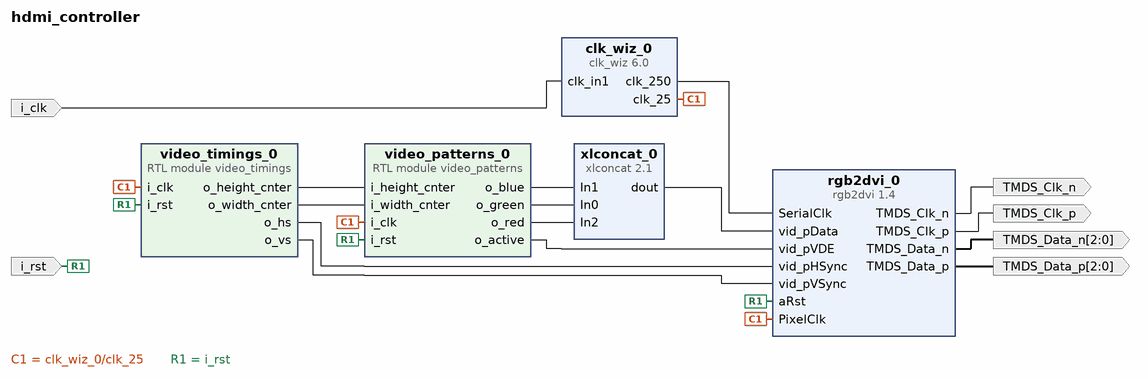
[diagram p0: block diagram of the top level]
# Vivado block design hdmi_controller, xc7z020clg400-1, Vivado 2025.2.1
create_bd_design hdmi_controller

create_bd_port -dir I -type clk i_clk
set_property -dict {CONFIG.FREQ_HZ 125000000} [get_bd_ports i_clk]
create_bd_port -dir I -type rst i_rst
set_property -dict {CONFIG.POLARITY ACTIVE_HIGH} [get_bd_ports i_rst]
create_bd_port -dir O -type clk TMDS_Clk_p
create_bd_port -dir O -type clk TMDS_Clk_n
create_bd_port -dir O -from 2 -to 0 TMDS_Data_p
create_bd_port -dir O -from 2 -to 0 TMDS_Data_n

create_bd_cell -type ip -vlnv digilentinc.com:ip:rgb2dvi:1.4 rgb2dvi_0
set_property -dict {CONFIG.kGenerateSerialClk false CONFIG.kRstActiveHigh true} [get_bd_cells rgb2dvi_0]
create_bd_cell -type module -reference video_timings video_timings_0
create_bd_cell -type module -reference video_patterns video_patterns_0
create_bd_cell -type ip -vlnv xilinx.com:ip:xlconcat:2.1 xlconcat_0
set_property -dict {CONFIG.IN0_WIDTH 8 CONFIG.IN1_WIDTH 8 CONFIG.IN2_WIDTH 8 CONFIG.NUM_PORTS 3} [get_bd_cells xlconcat_0]
create_bd_cell -type ip -vlnv xilinx.com:ip:clk_wiz:6.0 clk_wiz_0
set_property -dict [list \
  CONFIG.CLKIN1_JITTER_PS 80.0 \
  CONFIG.CLKOUT1_JITTER 165.419 \
  CONFIG.CLKOUT1_PHASE_ERROR 96.948 \
  CONFIG.CLKOUT1_REQUESTED_OUT_FREQ 25 \
  CONFIG.CLKOUT2_JITTER 104.759 \
  CONFIG.CLKOUT2_PHASE_ERROR 96.948 \
  CONFIG.CLKOUT2_REQUESTED_OUT_FREQ 250 \
  CONFIG.CLKOUT2_USED true \
  CONFIG.CLK_OUT1_PORT clk_25 \
  CONFIG.CLK_OUT2_PORT clk_250 \
  CONFIG.MMCM_CLKFBOUT_MULT_F 8.000 \
  CONFIG.MMCM_CLKIN1_PERIOD 8.000 \
  CONFIG.MMCM_CLKOUT0_DIVIDE_F 40.000 \
  CONFIG.MMCM_CLKOUT1_DIVIDE 4 \
  CONFIG.NUM_OUT_CLKS 2 \
  CONFIG.PRIM_IN_FREQ 125 \
  CONFIG.USE_LOCKED false \
  CONFIG.USE_RESET false \
] [get_bd_cells clk_wiz_0]

# ---- connections ----

connect_bd_net -net clk_in1_0_1 [get_bd_ports i_clk] [get_bd_pins clk_wiz_0/clk_in1]
connect_bd_net [get_bd_pins clk_wiz_0/clk_25] \
  [get_bd_pins video_timings_0/i_clk] [get_bd_pins rgb2dvi_0/PixelClk] [get_bd_pins video_patterns_0/i_clk]
connect_bd_net [get_bd_pins clk_wiz_0/clk_250] [get_bd_pins rgb2dvi_0/SerialClk]
connect_bd_net -net i_rst_0_1 [get_bd_ports i_rst] \
  [get_bd_pins video_timings_0/i_rst] [get_bd_pins rgb2dvi_0/aRst] [get_bd_pins video_patterns_0/i_rst]
connect_bd_net [get_bd_pins rgb2dvi_0/TMDS_Clk_n] [get_bd_ports TMDS_Clk_n]
connect_bd_net [get_bd_pins rgb2dvi_0/TMDS_Clk_p] [get_bd_ports TMDS_Clk_p]
connect_bd_net [get_bd_pins rgb2dvi_0/TMDS_Data_n] [get_bd_ports TMDS_Data_n]
connect_bd_net [get_bd_pins rgb2dvi_0/TMDS_Data_p] [get_bd_ports TMDS_Data_p]
connect_bd_net [get_bd_pins video_patterns_0/o_active] [get_bd_pins rgb2dvi_0/vid_pVDE]
connect_bd_net [get_bd_pins video_patterns_0/o_blue] [get_bd_pins xlconcat_0/In1]
connect_bd_net [get_bd_pins video_patterns_0/o_green] [get_bd_pins xlconcat_0/In0]
connect_bd_net [get_bd_pins video_patterns_0/o_red] [get_bd_pins xlconcat_0/In2]
connect_bd_net [get_bd_pins video_timings_0/o_height_cnter] [get_bd_pins video_patterns_0/i_height_cnter]
connect_bd_net [get_bd_pins video_timings_0/o_hs] [get_bd_pins rgb2dvi_0/vid_pHSync]
connect_bd_net [get_bd_pins video_timings_0/o_vs] [get_bd_pins rgb2dvi_0/vid_pVSync]
connect_bd_net [get_bd_pins video_timings_0/o_width_cnter] [get_bd_pins video_patterns_0/i_width_cnter]
connect_bd_net [get_bd_pins xlconcat_0/dout] [get_bd_pins rgb2dvi_0/vid_pData]

validate_bd_design
save_bd_design
